# Altium schematic sheet Power_Switch_Sheet.SchDoc
size A4; SheetNumber: 3; SheetTotal: 5
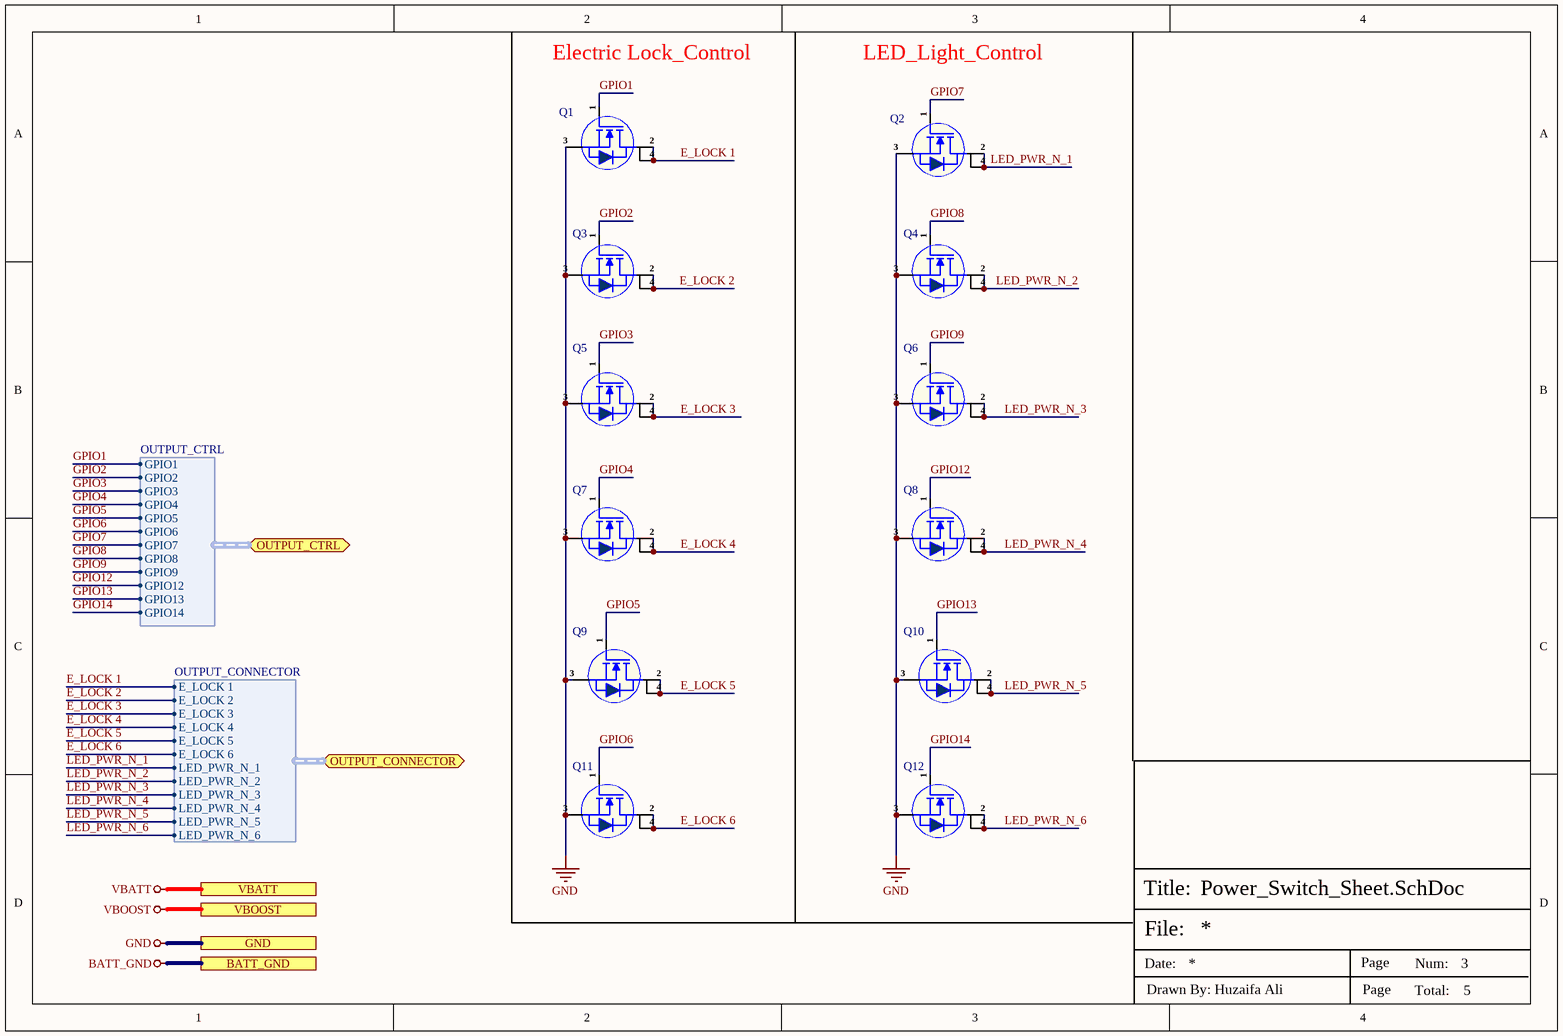
[diagram p0: Power_Switch_Sheet.SchDoc]

## Parts
Q1  BUK9832-55A/CUX  [SOT- 223]  (value not drawn)
Q2  BUK9832-55A/CUX  [SOT- 223]  (value not drawn)
Q3  BUK9832-55A/CUX  [SOT- 223]  (value not drawn)
Q4  BUK9832-55A/CUX  [SOT- 223]  (value not drawn)
Q5  BUK9832-55A/CUX  [SOT- 223]  (value not drawn)
Q6  BUK9832-55A/CUX  [SOT- 223]  (value not drawn)
Q7  BUK9832-55A/CUX  [SOT- 223]  (value not drawn)
Q8  BUK9832-55A/CUX  [SOT- 223]  (value not drawn)
Q9  BUK9832-55A/CUX  [SOT- 223]  (value not drawn)
Q10  BUK9832-55A/CUX  [SOT- 223]  (value not drawn)
Q11  BUK9832-55A/CUX  [SOT- 223]  (value not drawn)
Q12  BUK9832-55A/CUX  [SOT- 223]  (value not drawn)

## Ports
BATT_GND, GND, OUTPUT_CONNECTOR (bidir, harness OUTPUT_CONNECTOR), OUTPUT_CTRL (bidir, harness OUTPUT_CTRL), VBATT, VBOOST

## Harnesses
OUTPUT_CTRL: GPIO1, GPIO2, GPIO3, GPIO4, GPIO5, GPIO6, GPIO7, GPIO8, GPIO9, GPIO12, GPIO13, GPIO14
OUTPUT_CONNECTOR: E_LOCK 1, E_LOCK 2, E_LOCK 3, E_LOCK 4, E_LOCK 5, E_LOCK 6, LED_PWR_N_1, LED_PWR_N_2, LED_PWR_N_3, LED_PWR_N_4, LED_PWR_N_5, LED_PWR_N_6

## Nets
BATT_GND: port BATT_GND
GND: Q1.3(S) Q2.3(S) Q3.3(S) Q4.3(S) Q5.3(S) Q6.3(S) Q7.3(S) Q8.3(S) Q9.3(S) Q10.3(S) Q11.3(S) Q12.3(S) ; port GND
VBATT: port VBATT
VBOOST: port VBOOST
E_LOCK 1: Q1.2(D) Q1.4(D) ; port OUTPUT_CONNECTOR.E_LOCK 1
E_LOCK 2: Q3.2(D) Q3.4(D) ; port OUTPUT_CONNECTOR.E_LOCK 2
E_LOCK 3: Q5.2(D) Q5.4(D) ; port OUTPUT_CONNECTOR.E_LOCK 3
E_LOCK 4: Q7.2(D) Q7.4(D) ; port OUTPUT_CONNECTOR.E_LOCK 4
E_LOCK 5: Q9.2(D) Q9.4(D) ; port OUTPUT_CONNECTOR.E_LOCK 5
E_LOCK 6: Q11.2(D) Q11.4(D) ; port OUTPUT_CONNECTOR.E_LOCK 6
GPIO1: Q1.1(G) ; port OUTPUT_CTRL.GPIO1
GPIO2: Q3.1(G) ; port OUTPUT_CTRL.GPIO2
GPIO3: Q5.1(G) ; port OUTPUT_CTRL.GPIO3
GPIO4: Q7.1(G) ; port OUTPUT_CTRL.GPIO4
GPIO5: Q9.1(G) ; port OUTPUT_CTRL.GPIO5
GPIO6: Q11.1(G) ; port OUTPUT_CTRL.GPIO6
GPIO7: Q2.1(G) ; port OUTPUT_CTRL.GPIO7
GPIO8: Q4.1(G) ; port OUTPUT_CTRL.GPIO8
GPIO9: Q6.1(G) ; port OUTPUT_CTRL.GPIO9
GPIO12: Q8.1(G) ; port OUTPUT_CTRL.GPIO12
GPIO13: Q10.1(G) ; port OUTPUT_CTRL.GPIO13
GPIO14: Q12.1(G) ; port OUTPUT_CTRL.GPIO14
LED_PWR_N_1: Q2.2(D) Q2.4(D) ; port OUTPUT_CONNECTOR.LED_PWR_N_1
LED_PWR_N_2: Q4.2(D) Q4.4(D) ; port OUTPUT_CONNECTOR.LED_PWR_N_2
LED_PWR_N_3: Q6.2(D) Q6.4(D) ; port OUTPUT_CONNECTOR.LED_PWR_N_3
LED_PWR_N_4: Q8.2(D) Q8.4(D) ; port OUTPUT_CONNECTOR.LED_PWR_N_4
LED_PWR_N_5: Q10.2(D) Q10.4(D) ; port OUTPUT_CONNECTOR.LED_PWR_N_5
LED_PWR_N_6: Q12.2(D) Q12.4(D) ; port OUTPUT_CONNECTOR.LED_PWR_N_6

## Notes on the sheet
- Electric Lock_Control
- LED_Light_Control
- File:
- Title:
- Date:
- Page
- Num:
- Total:
- Drawn By: Huzaifa Ali

## Library data of the parts
Q1-Q12 = BUK9832-55A/CUX: MOSFET N-CH 55V 12A SOT223; Manufacturer: Nexperia; Item Type: MOSFETs; Input Capacitance: 1.594nF; Max Power Dissipation: 8W; Rds On Max: 29mR; Fall Time: 68ns; Gate to Source Voltage (Vgs): 10V; Rise Time: 125ns; Turn-Off Delay Time: 64ns; Turn-On Delay Time: 14ns; Supplier: Future Electronics; LCSC Part Number: C458151; Manufacturer Part Number: BUK9832-55A/CUX; RoHS: Yes; Stock: 59000; Pricing: 1000=0.305, 2000=0.295, 4000=0.29, 5000=0.29, 15000=0.275 (USD); Case/Package: 73Case; Pins: 4NUMBER; Contact Plating: 154ConductorMaterial; Min Operating Temperature: -55°C; Max Operating Temperature: 150°C; Packaging: 10Packaging; Continuous Drain Current (ID): 12A; Drain to Source Voltage (Vdss): 55V; Max Dual Supply Voltage: 55V; ComponentLink1URL: https://www.mouser.com/ds/2/302/BUK9832-55A-196161.pdf?src-supplier=Mouser; ComponentLink1Description: https://www.mouser.com/ds/2/302/BUK9832-55A-196161.pdf?src-supplier=Mouser; ComponentLink2URL: http://datasheet.octopart.com/BUK9832-55A-CUX-Nexperia-datasheet-87843131.pdf?src-supplier=Newark; ComponentLink2Description: http://datasheet.octopart.com/BUK9832-55A-CUX-Nexperia-datasheet-87843131.pdf?src-supplier=Newark; ComponentLink3URL: http://datasheet.octopart.com/BUK9832-55A-CUX-Nexperia-datasheet-87843131.pdf?src-supplier=Avnet; ComponentLink3Description: http://datasheet.octopart.com/BUK9832-55A-CUX-Nexperia-datasheet-87843131.pdf?src-supplier=Avnet; ComponentLink4URL: http://datasheet.octopart.com/BUK9832-55A-CUX-Nexperia-datasheet-87843131.pdf?src-supplier=Farnell; ComponentLink4Description: http://datasheet.octopart.com/BUK9832-55A-CUX-Nexperia-datasheet-87843131.pdf?src-supplier=Farnell; ComponentLink5URL: http://datasheet.octopart.com/BUK9832-55A-CUX-Nexperia-datasheet-87843131.pdf?src-supplier=Digikey; ComponentLink5Description: http://datasheet.octopart.com/BUK9832-55A-CUX-Nexperia-datasheet-87843131.pdf?src-supplier=Digikey; ComponentLink6URL: https://assets.nexperia.com/documents/data-sheet/BUK9832-55A.pdf?src-supplier=Digikey; ComponentLink6Description: https://assets.nexperia.com/documents/data-sheet/BUK9832-55A.pdf?src-supplier=Digikey; ComponentLink7URL: https://datasheet.octopart.com/BUK9832-55A-CUX-Nexperia-datasheet-87843131.pdf?src-supplier=Future+Electronics; ComponentLink7Description: https://datasheet.octopart.com/BUK9832-55A-CUX-Nexperia-datasheet-87843131.pdf?src-supplier=Future+Electronics; ComponentLink8URL: http://datasheet.octopart.com/BUK9832-55A-CUX-Nexperia-datasheet-87843131.pdf?src-supplier=TME; ComponentLink8Description: http://datasheet.octopart.com/BUK9832-55A-CUX-Nexperia-datasheet-87843131.pdf?src-supplier=TME; ComponentLink9URL: http://datasheet.octopart.com/BUK9832-55A-CUX-Nexperia-datasheet-87843131.pdf?src-supplier=Quest; ComponentLink9Description: http://datasheet.octopart.com/BUK9832-55A-CUX-Nexperia-datasheet-87843131.pdf?src-supplier=Quest; ComponentLink10URL: http://datasheet.octopart.com/BUK9832-55A-CUX-Nexperia-datasheet-87843131.pdf?src-supplier=TTI; ComponentLink10Description: http://datasheet.octopart.com/BUK9832-55A-CUX-Nexperia-datasheet-87843131.pdf?src-supplier=TTI